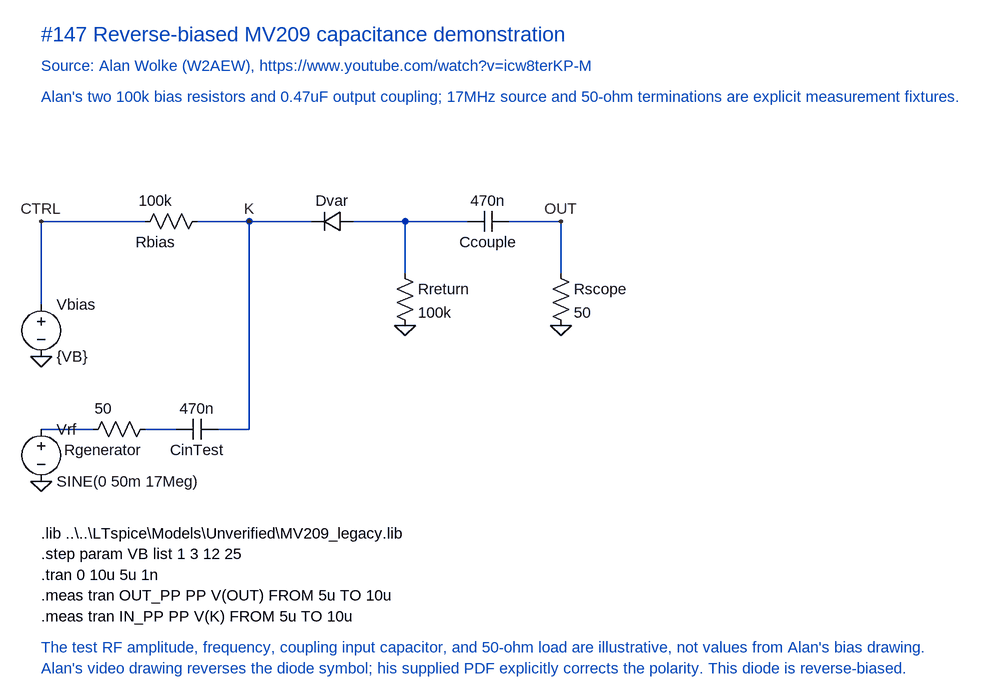
[diagram p0: schematic Varactor reverse-bias demonstration.asc]
Varactor reverse-bias demonstration.asc, the LTspice schematic file:
Version 4.1
SHEET 1 1280 850
WIRE 160 0 0 0
WIRE 320 0 240 0
WIRE 416 0 320 0
WIRE 560 0 480 0
WIRE 656 0 560 0
WIRE 800 0 720 0
WIRE 0 128 0 0
WIRE 560 80 560 0
WIRE 800 80 800 0
WIRE 80 320 0 320
WIRE 208 320 160 320
WIRE 320 320 272 320
WIRE 320 0 320 320
FLAG 0 208 0
FLAG 0 0 CTRL
FLAG 560 160 0
FLAG 800 160 0
FLAG 0 400 0
FLAG 800 0 OUT
FLAG 320 0 K
SYMBOL voltage 0 112 R0
SYMATTR InstName Vbias
SYMATTR Value {VB}
SYMBOL res 144 16 R270
WINDOW 0 0 32 VBottom 2
WINDOW 3 32 32 VTop 2
SYMATTR InstName Rbias
SYMATTR Value 100k
SYMBOL diode 480 -16 R90
WINDOW 0 0 32 VBottom 2
WINDOW 3 0 0 Invisible 2
SYMATTR InstName Dvar
SYMATTR Value MV209_LEGACY
SYMBOL res 544 64 R0
SYMATTR InstName Rreturn
SYMATTR Value 100k
SYMBOL cap 656 16 R270
WINDOW 0 0 32 VBottom 2
WINDOW 3 32 32 VTop 2
SYMATTR InstName Ccouple
SYMATTR Value 470n
SYMBOL res 784 64 R0
SYMATTR InstName Rscope
SYMATTR Value 50
SYMBOL voltage 0 304 R0
SYMATTR InstName Vrf
SYMATTR Value SINE(0 50m 17Meg)
SYMBOL res 64 336 R270
WINDOW 0 0 32 VBottom 2
WINDOW 3 32 32 VTop 2
SYMATTR InstName Rgenerator
SYMATTR Value 50
SYMBOL cap 208 336 R270
WINDOW 0 0 32 VBottom 2
WINDOW 3 32 32 VTop 2
SYMATTR InstName CinTest
SYMATTR Value 470n
TEXT 0 -288 Left 3 ;#147 Reverse-biased MV209 capacitance demonstration
TEXT 0 -240 Left 2 ;Source: Alan Wolke (W2AEW), https://www.youtube.com/watch?v=icw8terKP-M
TEXT 0 -192 Left 2 ;Alan's two 100k bias resistors and 0.47uF output coupling; 17MHz source and 50-ohm terminations are explicit measurement fixtures.
TEXT 0 480 Left 2 !.lib ..\..\LTspice\Models\Unverified\MV209_legacy.lib
TEXT 0 512 Left 2 !.step param VB list 1 3 12 25
TEXT 0 544 Left 2 !.tran 0 10u 5u 1n
TEXT 0 576 Left 2 !.meas tran OUT_PP PP V(OUT) FROM 5u TO 10u
TEXT 0 608 Left 2 !.meas tran IN_PP PP V(K) FROM 5u TO 10u
TEXT 0 656 Left 2 ;The test RF amplitude, frequency, coupling input capacitor, and 50-ohm load are illustrative, not values from Alan's bias drawing.
TEXT 0 688 Left 2 ;Alan's video drawing reverses the diode symbol; his supplied PDF explicitly corrects the polarity. This diode is reverse-biased.

The netlist it stands for:
* Varactor reverse-bias demonstration.asc
Vbias CTRL 0 {VB}
Rbias CTRL K 100k
Dvar N001 K MV209_LEGACY
Rreturn N001 0 100k
Ccouple N001 OUT 470n
Rscope OUT 0 50
Vrf N002 0 SINE(0 50m 17Meg)
Rgenerator N002 N003 50
CinTest N003 K 470n
.model D D
.lib standard.dio
* #147 Reverse-biased MV209 capacitance demonstration
* Source: Alan Wolke (W2AEW), https://www.youtube.com/watch?v=icw8terKP-M
* Alan's two 100k bias resistors and 0.47uF output coupling; 17MHz source and 50-ohm terminations are explicit measurement fixtures.
.lib ..\..\LTspice\Models\Unverified\MV209_legacy.lib
.step param VB list 1 3 12 25
.tran 0 10u 5u 1n
.meas tran OUT_PP PP V(OUT) FROM 5u TO 10u
.meas tran IN_PP PP V(K) FROM 5u TO 10u
* The test RF amplitude, frequency, coupling input capacitor, and 50-ohm load are illustrative, not values from Alan's bias drawing.
* Alan's video drawing reverses the diode symbol; his supplied PDF explicitly corrects the polarity. This diode is reverse-biased.
.backanno
.end